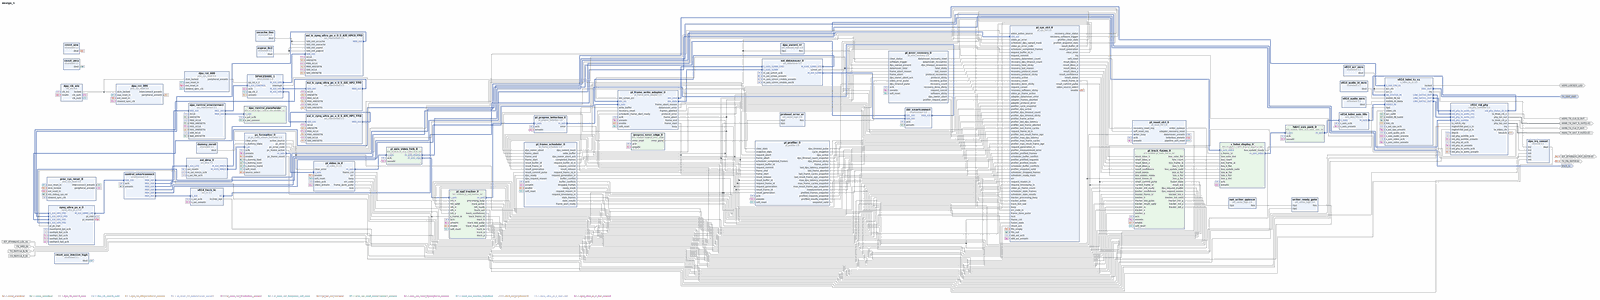
[diagram p0: block diagram of the top level, whole]
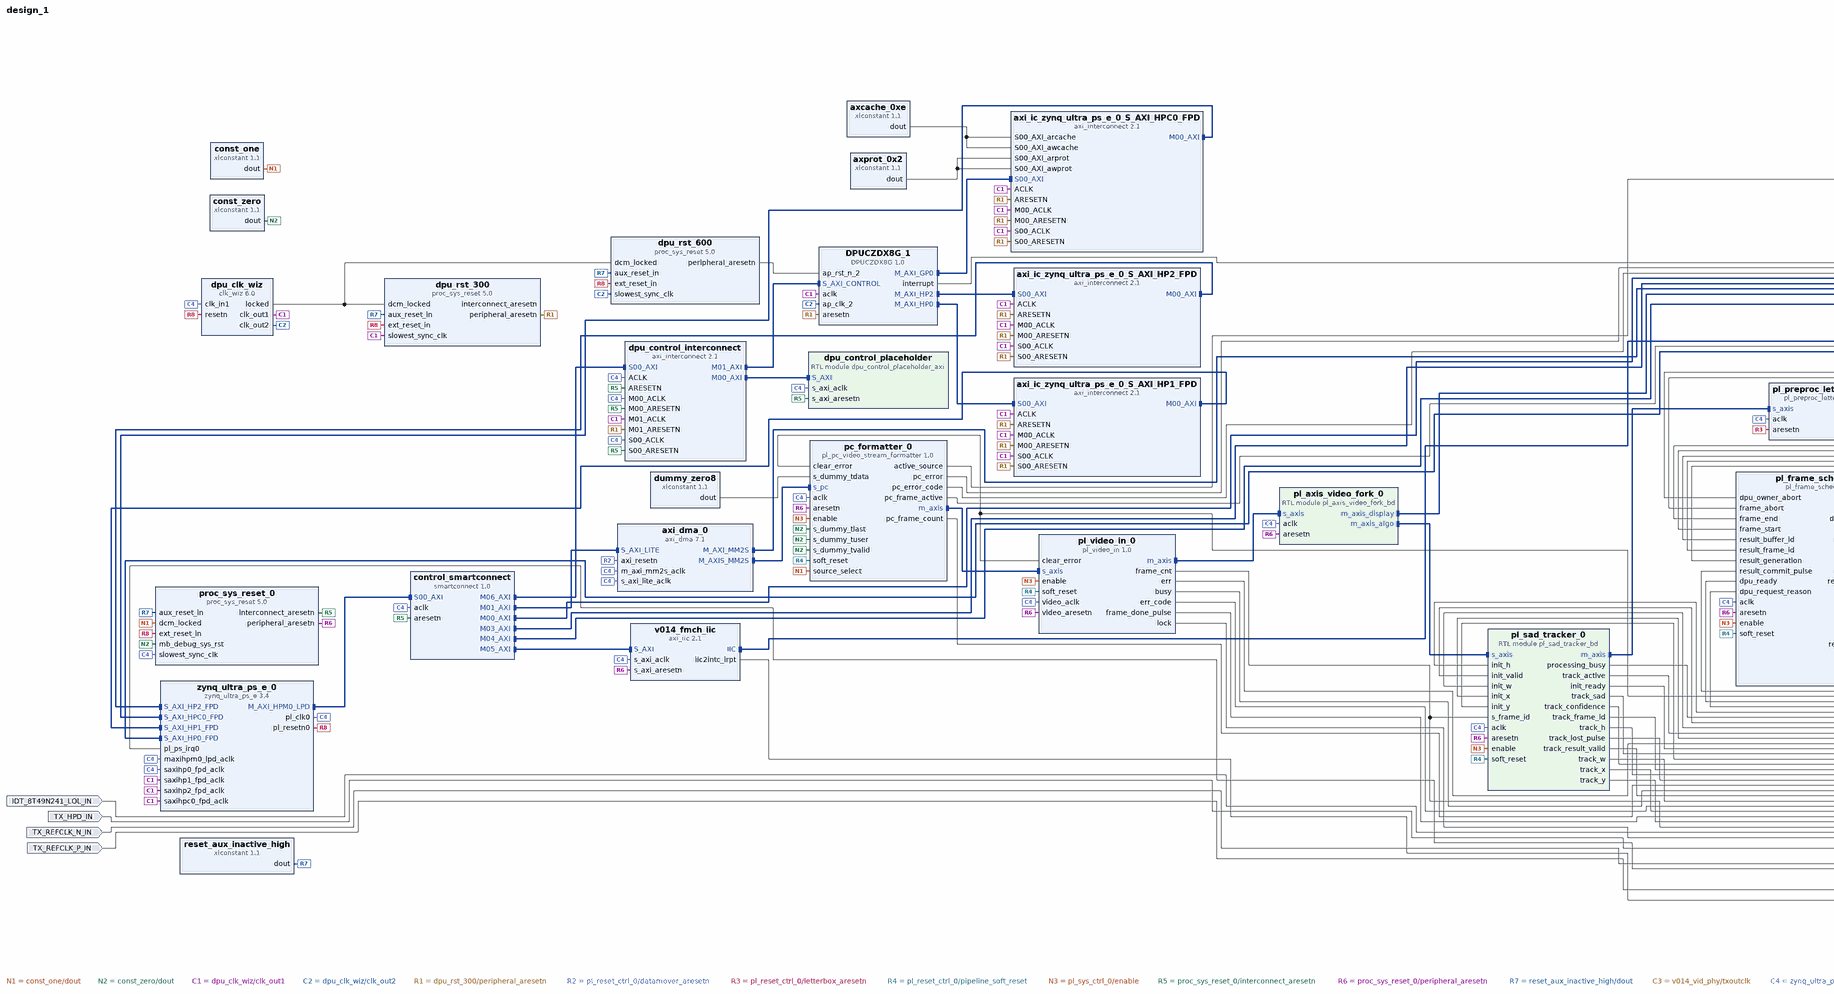
[diagram p1: block diagram of the top level, left part]
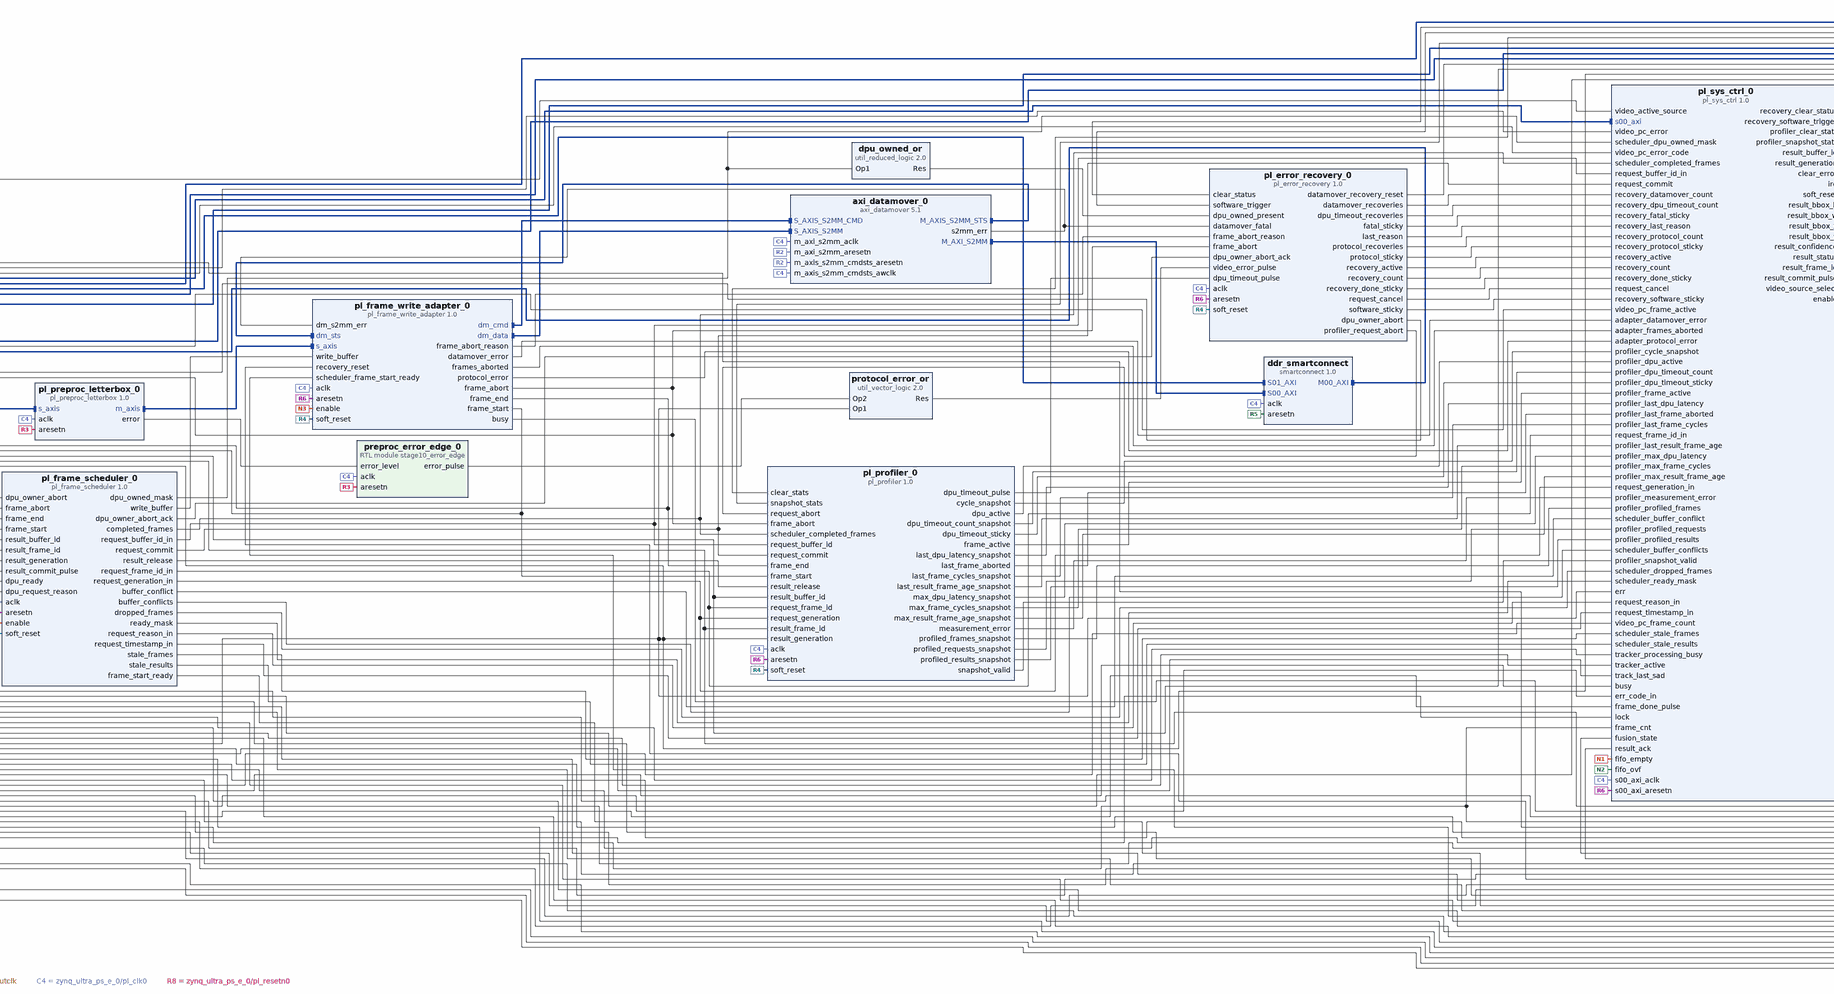
[diagram p2: block diagram of the top level, centre part]
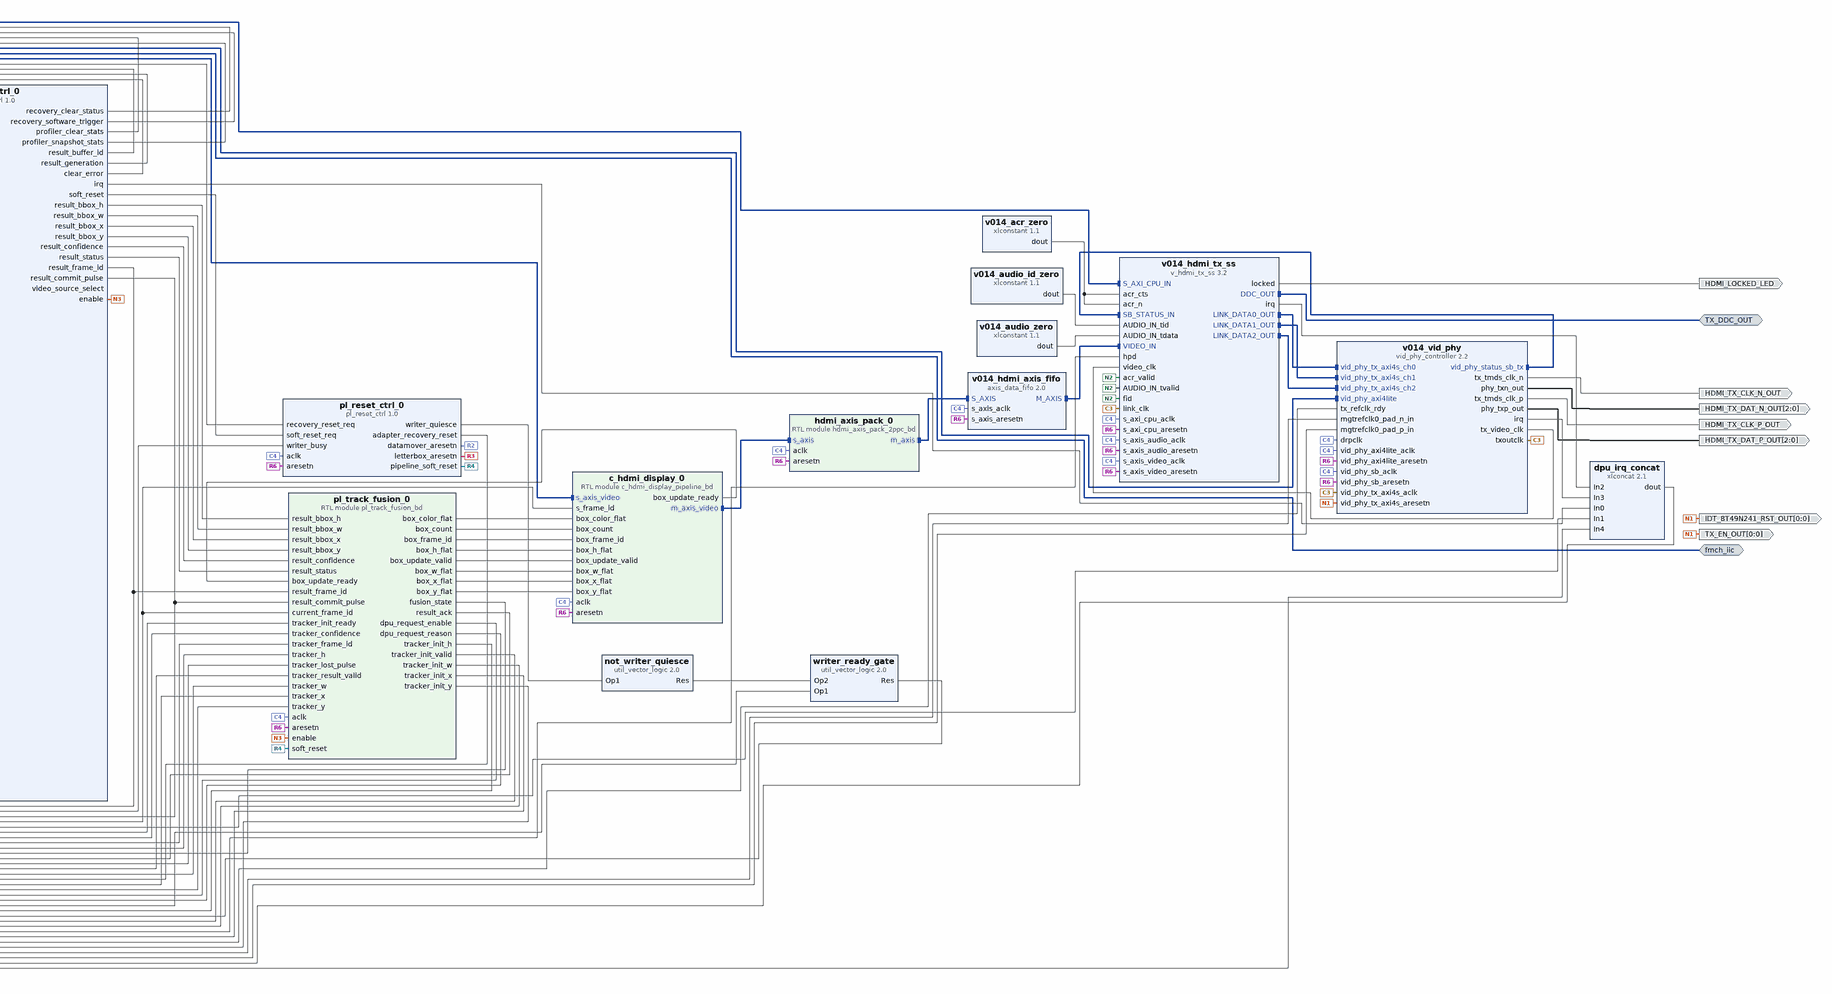
[diagram p3: block diagram of the top level, right part]
# Vivado block design design_1, xczu7ev-ffvc1156-2-e, Vivado 2022.2
create_bd_design design_1

create_bd_intf_port -mode Master -vlnv xilinx.com:interface:iic_rtl:1.0 TX_DDC_OUT
create_bd_intf_port -mode Master -vlnv xilinx.com:interface:iic_rtl:1.0 fmch_iic
create_bd_port -dir I TX_HPD_IN
create_bd_port -dir I -type clk TX_REFCLK_P_IN
create_bd_port -dir I -type clk TX_REFCLK_N_IN
create_bd_port -dir I IDT_8T49N241_LOL_IN
create_bd_port -dir O -from 0 -to 0 TX_EN_OUT
create_bd_port -dir O HDMI_LOCKED_LED
create_bd_port -dir O HDMI_TX_CLK_P_OUT
create_bd_port -dir O HDMI_TX_CLK_N_OUT
create_bd_port -dir O -from 2 -to 0 HDMI_TX_DAT_P_OUT
create_bd_port -dir O -from 2 -to 0 HDMI_TX_DAT_N_OUT
create_bd_port -dir O -from 0 -to 0 IDT_8T49N241_RST_OUT

create_bd_cell -type ip -vlnv xilinx.com:ip:axi_datamover:5.1 axi_datamover_0
set_property -dict [list \
  CONFIG.c_addr_width 40 \
  CONFIG.c_dummy 1 \
  CONFIG.c_enable_mm2s 0 \
  CONFIG.c_enable_s2mm 1 \
  CONFIG.c_include_s2mm Full \
  CONFIG.c_include_s2mm_dre false \
  CONFIG.c_include_s2mm_stsfifo true \
  CONFIG.c_m_axi_s2mm_addr_width 40 \
  CONFIG.c_m_axi_s2mm_data_width 64 \
  CONFIG.c_s2mm_btt_used 23 \
  CONFIG.c_s2mm_burst_size 16 \
  CONFIG.c_s2mm_support_indet_btt false \
  CONFIG.c_s_axis_s2mm_tdata_width 32 \
] [get_bd_cells axi_datamover_0]
create_bd_cell -type ip -vlnv xilinx.com:ip:axi_dma:7.1 axi_dma_0
set_property -dict [list \
  CONFIG.c_addr_width 32 \
  CONFIG.c_include_mm2s 1 \
  CONFIG.c_include_mm2s_dre 0 \
  CONFIG.c_include_mm2s_sf 1 \
  CONFIG.c_include_s2mm 0 \
  CONFIG.c_include_sg 0 \
  CONFIG.c_m_axi_mm2s_data_width 64 \
  CONFIG.c_m_axis_mm2s_tdata_width 8 \
  CONFIG.c_micro_dma 0 \
  CONFIG.c_mm2s_burst_size 16 \
  CONFIG.c_sg_length_width 23 \
] [get_bd_cells axi_dma_0]
create_bd_cell -type ip -vlnv xilinx.com:ip:xlconstant:1.1 const_one
set_property -dict {CONFIG.CONST_VAL 1 CONFIG.CONST_WIDTH 1} [get_bd_cells const_one]
create_bd_cell -type ip -vlnv xilinx.com:ip:xlconstant:1.1 const_zero
set_property -dict {CONFIG.CONST_VAL 0 CONFIG.CONST_WIDTH 1} [get_bd_cells const_zero]
create_bd_cell -type ip -vlnv xilinx.com:ip:smartconnect:1.0 control_smartconnect
set_property -dict {CONFIG.NUM_MI 7 CONFIG.NUM_SI 1} [get_bd_cells control_smartconnect]
create_bd_cell -type ip -vlnv xilinx.com:ip:util_vector_logic:2.0 writer_ready_gate
set_property -dict {CONFIG.C_OPERATION and CONFIG.C_SIZE 1} [get_bd_cells writer_ready_gate]
create_bd_cell -type ip -vlnv xilinx.com:ip:util_vector_logic:2.0 not_writer_quiesce
set_property -dict {CONFIG.C_OPERATION not CONFIG.C_SIZE 1} [get_bd_cells not_writer_quiesce]
create_bd_cell -type ip -vlnv xilinx.com:ip:smartconnect:1.0 ddr_smartconnect
set_property -dict {CONFIG.NUM_MI 1 CONFIG.NUM_SI 2} [get_bd_cells ddr_smartconnect]
create_bd_cell -type ip -vlnv xilinx.com:ip:util_reduced_logic:2.0 dpu_owned_or
set_property -dict {CONFIG.C_OPERATION or CONFIG.C_SIZE 3} [get_bd_cells dpu_owned_or]
create_bd_cell -type ip -vlnv xilinx.com:user:pl_pc_video_stream_formatter:1.0 pc_formatter_0
create_bd_cell -type ip -vlnv xilinx.com:user:pl_reset_ctrl:1.0 pl_reset_ctrl_0
create_bd_cell -type ip -vlnv xilinx.com:user:pl_error_recovery:1.0 pl_error_recovery_0
create_bd_cell -type ip -vlnv xilinx.com:user:pl_frame_write_adapter:1.0 pl_frame_write_adapter_0
set_property -dict {CONFIG.FRAME_BASE_ADDR 0x0020000000} [get_bd_cells pl_frame_write_adapter_0]
create_bd_cell -type ip -vlnv xilinx.com:user:pl_preproc_letterbox:1.0 pl_preproc_letterbox_0
create_bd_cell -type ip -vlnv xilinx.com:user:pl_profiler:1.0 pl_profiler_0
create_bd_cell -type ip -vlnv xilinx.com:user:pl_sys_ctrl:1.0 pl_sys_ctrl_0
create_bd_cell -type ip -vlnv xilinx.com:user:pl_video_in:1.0 pl_video_in_0
create_bd_cell -type module -reference stage10_error_edge preproc_error_edge_0
create_bd_cell -type ip -vlnv xilinx.com:ip:proc_sys_reset:5.0 proc_sys_reset_0
create_bd_cell -type ip -vlnv xilinx.com:ip:util_vector_logic:2.0 protocol_error_or
set_property -dict {CONFIG.C_OPERATION or CONFIG.C_SIZE 1} [get_bd_cells protocol_error_or]
create_bd_cell -type ip -vlnv xilinx.com:ip:zynq_ultra_ps_e:3.4 zynq_ultra_ps_e_0
set_property -dict [list \
  CONFIG.PSU__CRL_APB__PL0_REF_CTRL__FREQMHZ 100 \
  CONFIG.PSU__CRL_APB__PL0_REF_CTRL__SRCSEL IOPLL \
  CONFIG.PSU__DDR_HIGH_ADDRESS_GUI_ENABLE 0 \
  CONFIG.PSU__USE__IRQ 1 \
  CONFIG.PSU__USE__IRQ0 1 \
  CONFIG.PSU__USE__S_AXI_GP0 1 \
  CONFIG.PSU__USE__S_AXI_GP2 1 \
  CONFIG.PSU__USE__S_AXI_GP3 1 \
  CONFIG.PSU__USE__S_AXI_GP4 1 \
] [get_bd_cells zynq_ultra_ps_e_0]
# 31 more settings of zynq_ultra_ps_e_0 are not shown: defaults, MIO pin electricals, DDR timing, and values the tool derives
create_bd_cell -type ip -vlnv xilinx.com:ip:xlconstant:1.1 dummy_zero8
set_property -dict {CONFIG.CONST_VAL 0 CONFIG.CONST_WIDTH 8} [get_bd_cells dummy_zero8]
create_bd_cell -type module -reference pl_axis_video_fork_bd pl_axis_video_fork_0
create_bd_cell -type module -reference pl_sad_tracker_bd pl_sad_tracker_0
create_bd_cell -type module -reference pl_track_fusion_bd pl_track_fusion_0
create_bd_cell -type module -reference c_hdmi_display_pipeline_bd c_hdmi_display_0
create_bd_cell -type module -reference hdmi_axis_pack_2ppc_bd hdmi_axis_pack_0
create_bd_cell -type ip -vlnv xilinx.com:ip:clk_wiz:6.0 dpu_clk_wiz
set_property -dict [list \
  CONFIG.CLKOUT1_REQUESTED_OUT_FREQ 300.000 \
  CONFIG.CLKOUT2_REQUESTED_OUT_FREQ 600.000 \
  CONFIG.CLKOUT2_USED true \
  CONFIG.PRIM_IN_FREQ 99.999001 \
  CONFIG.PRIM_SOURCE No_buffer \
  CONFIG.RESET_TYPE ACTIVE_LOW \
  CONFIG.USE_LOCKED true \
  CONFIG.USE_RESET true \
] [get_bd_cells dpu_clk_wiz]
create_bd_cell -type ip -vlnv xilinx.com:ip:proc_sys_reset:5.0 dpu_rst_300
create_bd_cell -type ip -vlnv xilinx.com:ip:proc_sys_reset:5.0 dpu_rst_600
create_bd_cell -type ip -vlnv xilinx.com:ip:xlconcat:2.1 dpu_irq_concat
set_property -dict {CONFIG.NUM_PORTS 5} [get_bd_cells dpu_irq_concat]
create_bd_cell -type ip -vlnv xilinx.com:ip:axis_data_fifo:2.0 v014_hdmi_axis_fifo
set_property -dict [list \
  CONFIG.FIFO_DEPTH 1024 \
  CONFIG.HAS_TLAST 1 \
  CONFIG.IS_ACLK_ASYNC 0 \
  CONFIG.TDATA_NUM_BYTES 6 \
  CONFIG.TUSER_WIDTH 1 \
] [get_bd_cells v014_hdmi_axis_fifo]
create_bd_cell -type ip -vlnv xilinx.com:ip:v_hdmi_tx_ss:3.2 v014_hdmi_tx_ss
set_property -dict [list \
  CONFIG.C_ADDR_WIDTH 10 \
  CONFIG.C_EXDES_AXILITE_FREQ 100 \
  CONFIG.C_EXDES_TOPOLOGY 1 \
  CONFIG.C_EXDES_TX_PLL_SELECTION 6 \
  CONFIG.C_HDMI_FAST_SWITCH true \
  CONFIG.C_HDMI_VERSION 3 \
  CONFIG.C_HPD_INVERT false \
  CONFIG.C_INCLUDE_HDCP_1_4 false \
  CONFIG.C_INCLUDE_HDCP_2_2 false \
  CONFIG.C_INCLUDE_LOW_RESO_VID false \
  CONFIG.C_INCLUDE_YUV420_SUP false \
  CONFIG.C_INPUT_PIXELS_PER_CLOCK 2 \
  CONFIG.C_MAX_BITS_PER_COMPONENT 8 \
  CONFIG.C_VALIDATION_ENABLE false \
  CONFIG.C_VIDEO_MASK_ENABLE 1 \
  CONFIG.C_VID_INTERFACE 0 \
] [get_bd_cells v014_hdmi_tx_ss]
create_bd_cell -type ip -vlnv xilinx.com:ip:vid_phy_controller:2.2 v014_vid_phy
set_property -dict [list \
  CONFIG.CHANNEL_SITE X0Y16 \
  CONFIG.C_INPUT_PIXELS_PER_CLOCK 2 \
  CONFIG.C_INT_HDMI_VER_CMPTBLE 3 \
  CONFIG.C_RX_PLL_SELECTION 0 \
  CONFIG.C_RX_REFCLK_SEL 1 \
  CONFIG.C_Rx_Protocol None \
  CONFIG.C_TX_PLL_SELECTION 6 \
  CONFIG.C_TX_REFCLK_SEL 0 \
  CONFIG.C_Tx_Protocol HDMI \
  CONFIG.C_Txrefclk_Rdy_Invert true \
] [get_bd_cells v014_vid_phy]
create_bd_cell -type ip -vlnv xilinx.com:ip:axi_iic:2.1 v014_fmch_iic
set_property -dict {CONFIG.IIC_BOARD_INTERFACE Custom CONFIG.USE_BOARD_FLOW true} [get_bd_cells v014_fmch_iic]
create_bd_cell -type ip -vlnv xilinx.com:ip:xlconstant:1.1 v014_audio_zero
set_property -dict {CONFIG.CONST_VAL 0 CONFIG.CONST_WIDTH 32} [get_bd_cells v014_audio_zero]
create_bd_cell -type ip -vlnv xilinx.com:ip:xlconstant:1.1 v014_audio_id_zero
set_property -dict {CONFIG.CONST_VAL 0 CONFIG.CONST_WIDTH 8} [get_bd_cells v014_audio_id_zero]
create_bd_cell -type ip -vlnv xilinx.com:ip:xlconstant:1.1 v014_acr_zero
set_property -dict {CONFIG.CONST_VAL 0 CONFIG.CONST_WIDTH 20} [get_bd_cells v014_acr_zero]
create_bd_cell -type module -reference dpu_control_placeholder_axi dpu_control_placeholder
create_bd_cell -type ip -vlnv xilinx.com:ip:xlconstant:1.1 reset_aux_inactive_high
set_property -dict {CONFIG.CONST_VAL 1 CONFIG.CONST_WIDTH 1} [get_bd_cells reset_aux_inactive_high]
create_bd_cell -type ip -vlnv xilinx.com:user:pl_frame_scheduler:1.0 pl_frame_scheduler_0
create_bd_cell -type ip -vlnv xilinx.com:ip:axi_interconnect:2.1 dpu_control_interconnect
set_property -dict {CONFIG.M01_HAS_REGSLICE 1 CONFIG.NUM_MI 2 CONFIG.NUM_SI 1} [get_bd_cells dpu_control_interconnect]
create_bd_cell -type ip -vlnv xilinx.com:RTLKernel:DPUCZDX8G:1.0 DPUCZDX8G_1
create_bd_cell -type ip -vlnv xilinx.com:ip:axi_interconnect:2.1 axi_ic_zynq_ultra_ps_e_0_S_AXI_HPC0_FPD
set_property -dict [list \
  CONFIG.M00_HAS_REGSLICE 0 \
  CONFIG.NUM_MI 1 \
  CONFIG.NUM_SI 1 \
  CONFIG.S00_HAS_REGSLICE 0 \
] [get_bd_cells axi_ic_zynq_ultra_ps_e_0_S_AXI_HPC0_FPD]
create_bd_cell -type ip -vlnv xilinx.com:ip:axi_interconnect:2.1 axi_ic_zynq_ultra_ps_e_0_S_AXI_HP1_FPD
set_property -dict [list \
  CONFIG.M00_HAS_REGSLICE 0 \
  CONFIG.NUM_MI 1 \
  CONFIG.NUM_SI 1 \
  CONFIG.S00_HAS_REGSLICE 0 \
] [get_bd_cells axi_ic_zynq_ultra_ps_e_0_S_AXI_HP1_FPD]
create_bd_cell -type ip -vlnv xilinx.com:ip:axi_interconnect:2.1 axi_ic_zynq_ultra_ps_e_0_S_AXI_HP2_FPD
set_property -dict [list \
  CONFIG.M00_HAS_REGSLICE 0 \
  CONFIG.NUM_MI 1 \
  CONFIG.NUM_SI 1 \
  CONFIG.S00_HAS_REGSLICE 0 \
] [get_bd_cells axi_ic_zynq_ultra_ps_e_0_S_AXI_HP2_FPD]
create_bd_cell -type ip -vlnv xilinx.com:ip:xlconstant:1.1 axcache_0xe
set_property -dict {CONFIG.CONST_VAL 14 CONFIG.CONST_WIDTH 4} [get_bd_cells axcache_0xe]
create_bd_cell -type ip -vlnv xilinx.com:ip:xlconstant:1.1 axprot_0x2
set_property -dict {CONFIG.CONST_VAL 2 CONFIG.CONST_WIDTH 3} [get_bd_cells axprot_0x2]

# ---- connections ----

connect_bd_intf_net [get_bd_intf_pins DPUCZDX8G_1/M_AXI_GP0] [get_bd_intf_pins axi_ic_zynq_ultra_ps_e_0_S_AXI_HPC0_FPD/S00_AXI]
connect_bd_intf_net [get_bd_intf_pins DPUCZDX8G_1/M_AXI_HP0] [get_bd_intf_pins axi_ic_zynq_ultra_ps_e_0_S_AXI_HP1_FPD/S00_AXI]
connect_bd_intf_net [get_bd_intf_pins DPUCZDX8G_1/M_AXI_HP2] [get_bd_intf_pins axi_ic_zynq_ultra_ps_e_0_S_AXI_HP2_FPD/S00_AXI]
connect_bd_intf_net [get_bd_intf_pins axi_datamover_0/M_AXIS_S2MM_STS] [get_bd_intf_pins pl_frame_write_adapter_0/dm_sts]
connect_bd_intf_net [get_bd_intf_pins axi_datamover_0/M_AXI_S2MM] [get_bd_intf_pins ddr_smartconnect/S00_AXI]
connect_bd_intf_net [get_bd_intf_pins axi_dma_0/M_AXIS_MM2S] [get_bd_intf_pins pc_formatter_0/s_pc]
connect_bd_intf_net [get_bd_intf_pins axi_dma_0/M_AXI_MM2S] [get_bd_intf_pins ddr_smartconnect/S01_AXI]
connect_bd_intf_net [get_bd_intf_pins axi_ic_zynq_ultra_ps_e_0_S_AXI_HP1_FPD/M00_AXI] [get_bd_intf_pins zynq_ultra_ps_e_0/S_AXI_HP1_FPD]
connect_bd_intf_net [get_bd_intf_pins axi_ic_zynq_ultra_ps_e_0_S_AXI_HP2_FPD/M00_AXI] [get_bd_intf_pins zynq_ultra_ps_e_0/S_AXI_HP2_FPD]
connect_bd_intf_net [get_bd_intf_pins axi_ic_zynq_ultra_ps_e_0_S_AXI_HPC0_FPD/M00_AXI] [get_bd_intf_pins zynq_ultra_ps_e_0/S_AXI_HPC0_FPD]
connect_bd_intf_net [get_bd_intf_pins c_hdmi_display_0/m_axis_video] [get_bd_intf_pins hdmi_axis_pack_0/s_axis]
connect_bd_intf_net [get_bd_intf_pins control_smartconnect/M00_AXI] [get_bd_intf_pins pl_sys_ctrl_0/s00_axi]
connect_bd_intf_net [get_bd_intf_pins control_smartconnect/M01_AXI] [get_bd_intf_pins axi_dma_0/S_AXI_LITE]
connect_bd_intf_net [get_bd_intf_pins control_smartconnect/M03_AXI] [get_bd_intf_pins v014_hdmi_tx_ss/S_AXI_CPU_IN]
connect_bd_intf_net [get_bd_intf_pins control_smartconnect/M04_AXI] [get_bd_intf_pins v014_vid_phy/vid_phy_axi4lite]
connect_bd_intf_net [get_bd_intf_pins control_smartconnect/M05_AXI] [get_bd_intf_pins v014_fmch_iic/S_AXI]
connect_bd_intf_net [get_bd_intf_pins control_smartconnect/M06_AXI] [get_bd_intf_pins dpu_control_interconnect/S00_AXI]
connect_bd_intf_net [get_bd_intf_pins ddr_smartconnect/M00_AXI] [get_bd_intf_pins zynq_ultra_ps_e_0/S_AXI_HP0_FPD]
connect_bd_intf_net [get_bd_intf_pins dpu_control_interconnect/M00_AXI] [get_bd_intf_pins dpu_control_placeholder/S_AXI]
connect_bd_intf_net [get_bd_intf_pins dpu_control_interconnect/M01_AXI] [get_bd_intf_pins DPUCZDX8G_1/S_AXI_CONTROL]
connect_bd_intf_net [get_bd_intf_pins v014_hdmi_axis_fifo/S_AXIS] [get_bd_intf_pins hdmi_axis_pack_0/m_axis]
connect_bd_intf_net [get_bd_intf_pins pc_formatter_0/m_axis] [get_bd_intf_pins pl_video_in_0/s_axis]
connect_bd_intf_net [get_bd_intf_pins pl_axis_video_fork_0/m_axis_algo] [get_bd_intf_pins pl_sad_tracker_0/s_axis]
connect_bd_intf_net [get_bd_intf_pins pl_axis_video_fork_0/m_axis_display] [get_bd_intf_pins c_hdmi_display_0/s_axis_video]
connect_bd_intf_net [get_bd_intf_pins axi_datamover_0/S_AXIS_S2MM_CMD] [get_bd_intf_pins pl_frame_write_adapter_0/dm_cmd]
connect_bd_intf_net [get_bd_intf_pins axi_datamover_0/S_AXIS_S2MM] [get_bd_intf_pins pl_frame_write_adapter_0/dm_data]
connect_bd_intf_net [get_bd_intf_pins pl_frame_write_adapter_0/s_axis] [get_bd_intf_pins pl_preproc_letterbox_0/m_axis]
connect_bd_intf_net [get_bd_intf_pins pl_sad_tracker_0/m_axis] [get_bd_intf_pins pl_preproc_letterbox_0/s_axis]
connect_bd_intf_net [get_bd_intf_pins pl_video_in_0/m_axis] [get_bd_intf_pins pl_axis_video_fork_0/s_axis]
connect_bd_intf_net [get_bd_intf_ports fmch_iic] [get_bd_intf_pins v014_fmch_iic/IIC]
connect_bd_intf_net [get_bd_intf_pins v014_hdmi_axis_fifo/M_AXIS] [get_bd_intf_pins v014_hdmi_tx_ss/VIDEO_IN]
connect_bd_intf_net [get_bd_intf_ports TX_DDC_OUT] [get_bd_intf_pins v014_hdmi_tx_ss/DDC_OUT]
connect_bd_intf_net [get_bd_intf_pins v014_hdmi_tx_ss/LINK_DATA0_OUT] [get_bd_intf_pins v014_vid_phy/vid_phy_tx_axi4s_ch0]
connect_bd_intf_net [get_bd_intf_pins v014_hdmi_tx_ss/LINK_DATA1_OUT] [get_bd_intf_pins v014_vid_phy/vid_phy_tx_axi4s_ch1]
connect_bd_intf_net [get_bd_intf_pins v014_hdmi_tx_ss/LINK_DATA2_OUT] [get_bd_intf_pins v014_vid_phy/vid_phy_tx_axi4s_ch2]
connect_bd_intf_net [get_bd_intf_pins v014_vid_phy/vid_phy_status_sb_tx] [get_bd_intf_pins v014_hdmi_tx_ss/SB_STATUS_IN]
connect_bd_intf_net [get_bd_intf_pins control_smartconnect/S00_AXI] [get_bd_intf_pins zynq_ultra_ps_e_0/M_AXI_HPM0_LPD]
connect_bd_net [get_bd_pins DPUCZDX8G_1/interrupt] [get_bd_pins dpu_irq_concat/In1]
connect_bd_net [get_bd_ports IDT_8T49N241_LOL_IN] [get_bd_pins v014_vid_phy/tx_refclk_rdy]
connect_bd_net [get_bd_ports TX_HPD_IN] [get_bd_pins v014_hdmi_tx_ss/hpd]
connect_bd_net [get_bd_ports TX_REFCLK_N_IN] [get_bd_pins v014_vid_phy/mgtrefclk0_pad_n_in]
connect_bd_net [get_bd_ports TX_REFCLK_P_IN] [get_bd_pins v014_vid_phy/mgtrefclk0_pad_p_in]
connect_bd_net [get_bd_pins axcache_0xe/dout] \
  [get_bd_pins axi_ic_zynq_ultra_ps_e_0_S_AXI_HPC0_FPD/S00_AXI_arcache] \
  [get_bd_pins axi_ic_zynq_ultra_ps_e_0_S_AXI_HPC0_FPD/S00_AXI_awcache]
connect_bd_net [get_bd_pins axi_datamover_0/s2mm_err] \
  [get_bd_pins pl_error_recovery_0/datamover_fatal] [get_bd_pins pl_frame_write_adapter_0/dm_s2mm_err]
connect_bd_net [get_bd_pins axprot_0x2/dout] \
  [get_bd_pins axi_ic_zynq_ultra_ps_e_0_S_AXI_HPC0_FPD/S00_AXI_arprot] \
  [get_bd_pins axi_ic_zynq_ultra_ps_e_0_S_AXI_HPC0_FPD/S00_AXI_awprot]
connect_bd_net [get_bd_pins c_hdmi_display_0/box_update_ready] [get_bd_pins pl_track_fusion_0/box_update_ready]
connect_bd_net [get_bd_pins const_one/dout] \
  [get_bd_pins pl_sys_ctrl_0/fifo_empty] [get_bd_pins proc_sys_reset_0/dcm_locked] [get_bd_pins pc_formatter_0/source_select] \
  [get_bd_ports TX_EN_OUT] [get_bd_pins v014_vid_phy/vid_phy_tx_axi4s_aresetn] [get_bd_ports IDT_8T49N241_RST_OUT]
connect_bd_net [get_bd_pins const_zero/dout] \
  [get_bd_pins pl_sys_ctrl_0/fifo_ovf] [get_bd_pins proc_sys_reset_0/mb_debug_sys_rst] \
  [get_bd_pins pc_formatter_0/s_dummy_tvalid] [get_bd_pins pc_formatter_0/s_dummy_tuser] \
  [get_bd_pins pc_formatter_0/s_dummy_tlast] [get_bd_pins v014_hdmi_tx_ss/AUDIO_IN_tvalid] \
  [get_bd_pins v014_hdmi_tx_ss/acr_valid] [get_bd_pins v014_hdmi_tx_ss/fid]
connect_bd_net [get_bd_pins dpu_clk_wiz/clk_out1] \
  [get_bd_pins dpu_rst_300/slowest_sync_clk] [get_bd_pins zynq_ultra_ps_e_0/saxihpc0_fpd_aclk] \
  [get_bd_pins zynq_ultra_ps_e_0/saxihp1_fpd_aclk] [get_bd_pins zynq_ultra_ps_e_0/saxihp2_fpd_aclk] \
  [get_bd_pins DPUCZDX8G_1/aclk] [get_bd_pins axi_ic_zynq_ultra_ps_e_0_S_AXI_HPC0_FPD/M00_ACLK] \
  [get_bd_pins axi_ic_zynq_ultra_ps_e_0_S_AXI_HPC0_FPD/S00_ACLK] [get_bd_pins axi_ic_zynq_ultra_ps_e_0_S_AXI_HPC0_FPD/ACLK] \
  [get_bd_pins axi_ic_zynq_ultra_ps_e_0_S_AXI_HP1_FPD/M00_ACLK] [get_bd_pins axi_ic_zynq_ultra_ps_e_0_S_AXI_HP1_FPD/S00_ACLK] \
  [get_bd_pins axi_ic_zynq_ultra_ps_e_0_S_AXI_HP1_FPD/ACLK] [get_bd_pins axi_ic_zynq_ultra_ps_e_0_S_AXI_HP2_FPD/M00_ACLK] \
  [get_bd_pins axi_ic_zynq_ultra_ps_e_0_S_AXI_HP2_FPD/S00_ACLK] [get_bd_pins axi_ic_zynq_ultra_ps_e_0_S_AXI_HP2_FPD/ACLK] \
  [get_bd_pins dpu_control_interconnect/M01_ACLK]
connect_bd_net [get_bd_pins dpu_clk_wiz/clk_out2] [get_bd_pins dpu_rst_600/slowest_sync_clk] [get_bd_pins DPUCZDX8G_1/ap_clk_2]
connect_bd_net [get_bd_pins dpu_clk_wiz/locked] [get_bd_pins dpu_rst_300/dcm_locked] [get_bd_pins dpu_rst_600/dcm_locked]
connect_bd_net [get_bd_pins dpu_irq_concat/dout] [get_bd_pins zynq_ultra_ps_e_0/pl_ps_irq0]
connect_bd_net [get_bd_pins dpu_owned_or/Res] [get_bd_pins pl_error_recovery_0/dpu_owned_present]
# net dpu_rst_300_interconnect_aresetn has one end: dpu_rst_300/interconnect_aresetn
connect_bd_net [get_bd_pins dpu_rst_300/peripheral_aresetn] \
  [get_bd_pins DPUCZDX8G_1/aresetn] [get_bd_pins axi_ic_zynq_ultra_ps_e_0_S_AXI_HPC0_FPD/M00_ARESETN] \
  [get_bd_pins axi_ic_zynq_ultra_ps_e_0_S_AXI_HPC0_FPD/S00_ARESETN] \
  [get_bd_pins axi_ic_zynq_ultra_ps_e_0_S_AXI_HPC0_FPD/ARESETN] \
  [get_bd_pins axi_ic_zynq_ultra_ps_e_0_S_AXI_HP1_FPD/M00_ARESETN] \
  [get_bd_pins axi_ic_zynq_ultra_ps_e_0_S_AXI_HP1_FPD/S00_ARESETN] \
  [get_bd_pins axi_ic_zynq_ultra_ps_e_0_S_AXI_HP1_FPD/ARESETN] \
  [get_bd_pins axi_ic_zynq_ultra_ps_e_0_S_AXI_HP2_FPD/M00_ARESETN] \
  [get_bd_pins axi_ic_zynq_ultra_ps_e_0_S_AXI_HP2_FPD/S00_ARESETN] \
  [get_bd_pins axi_ic_zynq_ultra_ps_e_0_S_AXI_HP2_FPD/ARESETN] [get_bd_pins dpu_control_interconnect/M01_ARESETN]
connect_bd_net [get_bd_pins dpu_rst_600/peripheral_aresetn] [get_bd_pins DPUCZDX8G_1/ap_rst_n_2]
connect_bd_net [get_bd_pins dummy_zero8/dout] [get_bd_pins pc_formatter_0/s_dummy_tdata]
connect_bd_net [get_bd_pins not_writer_quiesce/Res] [get_bd_pins writer_ready_gate/Op2]
connect_bd_net [get_bd_pins pc_formatter_0/active_source] [get_bd_pins pl_sys_ctrl_0/video_active_source]
connect_bd_net [get_bd_pins pc_formatter_0/pc_error] [get_bd_pins pl_sys_ctrl_0/video_pc_error]
connect_bd_net [get_bd_pins pc_formatter_0/pc_error_code] [get_bd_pins pl_sys_ctrl_0/video_pc_error_code]
connect_bd_net [get_bd_pins pc_formatter_0/pc_frame_active] [get_bd_pins pl_sys_ctrl_0/video_pc_frame_active]
connect_bd_net [get_bd_pins pc_formatter_0/pc_frame_count] [get_bd_pins pl_sys_ctrl_0/video_pc_frame_count]
connect_bd_net [get_bd_pins pl_error_recovery_0/datamover_recoveries] [get_bd_pins pl_sys_ctrl_0/recovery_datamover_count]
connect_bd_net [get_bd_pins pl_error_recovery_0/datamover_recovery_reset] [get_bd_pins pl_reset_ctrl_0/recovery_reset_req]
connect_bd_net [get_bd_pins pl_error_recovery_0/dpu_owner_abort] [get_bd_pins pl_frame_scheduler_0/dpu_owner_abort]
connect_bd_net [get_bd_pins pl_error_recovery_0/dpu_timeout_recoveries] [get_bd_pins pl_sys_ctrl_0/recovery_dpu_timeout_count]
connect_bd_net [get_bd_pins pl_error_recovery_0/fatal_sticky] [get_bd_pins pl_sys_ctrl_0/recovery_fatal_sticky]
connect_bd_net [get_bd_pins pl_error_recovery_0/last_reason] [get_bd_pins pl_sys_ctrl_0/recovery_last_reason]
connect_bd_net [get_bd_pins pl_error_recovery_0/profiler_request_abort] [get_bd_pins pl_profiler_0/request_abort]
connect_bd_net [get_bd_pins pl_error_recovery_0/protocol_recoveries] [get_bd_pins pl_sys_ctrl_0/recovery_protocol_count]
connect_bd_net [get_bd_pins pl_error_recovery_0/protocol_sticky] [get_bd_pins pl_sys_ctrl_0/recovery_protocol_sticky]
connect_bd_net [get_bd_pins pl_error_recovery_0/recovery_active] [get_bd_pins pl_sys_ctrl_0/recovery_active]
connect_bd_net [get_bd_pins pl_error_recovery_0/recovery_count] [get_bd_pins pl_sys_ctrl_0/recovery_count]
connect_bd_net [get_bd_pins pl_error_recovery_0/recovery_done_sticky] [get_bd_pins pl_sys_ctrl_0/recovery_done_sticky]
connect_bd_net [get_bd_pins pl_error_recovery_0/request_cancel] [get_bd_pins pl_sys_ctrl_0/request_cancel]
connect_bd_net [get_bd_pins pl_error_recovery_0/software_sticky] [get_bd_pins pl_sys_ctrl_0/recovery_software_sticky]
connect_bd_net [get_bd_pins pl_frame_scheduler_0/buffer_conflict] [get_bd_pins pl_sys_ctrl_0/scheduler_buffer_conflict]
connect_bd_net [get_bd_pins pl_frame_scheduler_0/buffer_conflicts] [get_bd_pins pl_sys_ctrl_0/scheduler_buffer_conflicts]
connect_bd_net [get_bd_pins pl_frame_scheduler_0/completed_frames] \
  [get_bd_pins pl_profiler_0/scheduler_completed_frames] [get_bd_pins pl_sys_ctrl_0/scheduler_completed_frames]
connect_bd_net [get_bd_pins pl_frame_scheduler_0/dpu_owned_mask] [get_bd_pins dpu_owned_or/Op1] [get_bd_pins pl_sys_ctrl_0/scheduler_dpu_owned_mask]
connect_bd_net [get_bd_pins pl_frame_scheduler_0/dpu_owner_abort_ack] [get_bd_pins pl_error_recovery_0/dpu_owner_abort_ack]
connect_bd_net [get_bd_pins pl_frame_scheduler_0/dropped_frames] [get_bd_pins pl_sys_ctrl_0/scheduler_dropped_frames]
connect_bd_net [get_bd_pins pl_frame_scheduler_0/frame_start_ready] [get_bd_pins writer_ready_gate/Op1]
connect_bd_net [get_bd_pins pl_frame_scheduler_0/ready_mask] [get_bd_pins pl_sys_ctrl_0/scheduler_ready_mask]
connect_bd_net [get_bd_pins pl_frame_scheduler_0/request_buffer_id_in] \
  [get_bd_pins pl_profiler_0/request_buffer_id] [get_bd_pins pl_sys_ctrl_0/request_buffer_id_in]
connect_bd_net [get_bd_pins pl_frame_scheduler_0/request_commit] [get_bd_pins pl_profiler_0/request_commit] [get_bd_pins pl_sys_ctrl_0/request_commit]
connect_bd_net [get_bd_pins pl_frame_scheduler_0/request_frame_id_in] \
  [get_bd_pins pl_profiler_0/request_frame_id] [get_bd_pins pl_sys_ctrl_0/request_frame_id_in]
connect_bd_net [get_bd_pins pl_frame_scheduler_0/request_generation_in] \
  [get_bd_pins pl_profiler_0/request_generation] [get_bd_pins pl_sys_ctrl_0/request_generation_in]
connect_bd_net [get_bd_pins pl_frame_scheduler_0/request_reason_in] [get_bd_pins pl_sys_ctrl_0/request_reason_in]
connect_bd_net [get_bd_pins pl_frame_scheduler_0/request_timestamp_in] [get_bd_pins pl_sys_ctrl_0/request_timestamp_in]
connect_bd_net [get_bd_pins pl_frame_scheduler_0/result_release] [get_bd_pins pl_profiler_0/result_release]
connect_bd_net [get_bd_pins pl_frame_scheduler_0/stale_frames] [get_bd_pins pl_sys_ctrl_0/scheduler_stale_frames]
connect_bd_net [get_bd_pins pl_frame_scheduler_0/stale_results] [get_bd_pins pl_sys_ctrl_0/scheduler_stale_results]
connect_bd_net [get_bd_pins pl_frame_scheduler_0/write_buffer] [get_bd_pins pl_frame_write_adapter_0/write_buffer]
connect_bd_net [get_bd_pins pl_frame_write_adapter_0/busy] [get_bd_pins pl_reset_ctrl_0/writer_busy]
connect_bd_net [get_bd_pins pl_frame_write_adapter_0/datamover_error] [get_bd_pins pl_sys_ctrl_0/adapter_datamover_error]
connect_bd_net [get_bd_pins pl_frame_write_adapter_0/frame_abort] \
  [get_bd_pins pl_error_recovery_0/frame_abort] [get_bd_pins pl_profiler_0/frame_abort] \
  [get_bd_pins pl_frame_scheduler_0/frame_abort]
connect_bd_net [get_bd_pins pl_frame_write_adapter_0/frame_abort_reason] [get_bd_pins pl_error_recovery_0/frame_abort_reason]
connect_bd_net [get_bd_pins pl_frame_write_adapter_0/frame_end] [get_bd_pins pl_profiler_0/frame_end] [get_bd_pins pl_frame_scheduler_0/frame_end]
connect_bd_net [get_bd_pins pl_frame_write_adapter_0/frame_start] \
  [get_bd_pins pl_profiler_0/frame_start] [get_bd_pins pl_frame_scheduler_0/frame_start]
connect_bd_net [get_bd_pins pl_frame_write_adapter_0/frames_aborted] [get_bd_pins pl_sys_ctrl_0/adapter_frames_aborted]
connect_bd_net [get_bd_pins pl_frame_write_adapter_0/protocol_error] [get_bd_pins pl_sys_ctrl_0/adapter_protocol_error]
connect_bd_net [get_bd_pins pl_preproc_letterbox_0/error] [get_bd_pins preproc_error_edge_0/error_level]
connect_bd_net [get_bd_pins pl_profiler_0/cycle_snapshot] [get_bd_pins pl_sys_ctrl_0/profiler_cycle_snapshot]
connect_bd_net [get_bd_pins pl_profiler_0/dpu_active] [get_bd_pins pl_sys_ctrl_0/profiler_dpu_active]
connect_bd_net [get_bd_pins pl_profiler_0/dpu_timeout_count_snapshot] [get_bd_pins pl_sys_ctrl_0/profiler_dpu_timeout_count]
connect_bd_net [get_bd_pins pl_profiler_0/dpu_timeout_pulse] [get_bd_pins pl_error_recovery_0/dpu_timeout_pulse]
connect_bd_net [get_bd_pins pl_profiler_0/dpu_timeout_sticky] [get_bd_pins pl_sys_ctrl_0/profiler_dpu_timeout_sticky]
connect_bd_net [get_bd_pins pl_profiler_0/frame_active] [get_bd_pins pl_sys_ctrl_0/profiler_frame_active]
connect_bd_net [get_bd_pins pl_profiler_0/last_dpu_latency_snapshot] [get_bd_pins pl_sys_ctrl_0/profiler_last_dpu_latency]
connect_bd_net [get_bd_pins pl_profiler_0/last_frame_aborted] [get_bd_pins pl_sys_ctrl_0/profiler_last_frame_aborted]
connect_bd_net [get_bd_pins pl_profiler_0/last_frame_cycles_snapshot] [get_bd_pins pl_sys_ctrl_0/profiler_last_frame_cycles]
connect_bd_net [get_bd_pins pl_profiler_0/last_result_frame_age_snapshot] [get_bd_pins pl_sys_ctrl_0/profiler_last_result_frame_age]
connect_bd_net [get_bd_pins pl_profiler_0/max_dpu_latency_snapshot] [get_bd_pins pl_sys_ctrl_0/profiler_max_dpu_latency]
connect_bd_net [get_bd_pins pl_profiler_0/max_frame_cycles_snapshot] [get_bd_pins pl_sys_ctrl_0/profiler_max_frame_cycles]
connect_bd_net [get_bd_pins pl_profiler_0/max_result_frame_age_snapshot] [get_bd_pins pl_sys_ctrl_0/profiler_max_result_frame_age]
connect_bd_net [get_bd_pins pl_profiler_0/measurement_error] [get_bd_pins pl_sys_ctrl_0/profiler_measurement_error]
connect_bd_net [get_bd_pins pl_profiler_0/profiled_frames_snapshot] [get_bd_pins pl_sys_ctrl_0/profiler_profiled_frames]
connect_bd_net [get_bd_pins pl_profiler_0/profiled_requests_snapshot] [get_bd_pins pl_sys_ctrl_0/profiler_profiled_requests]
connect_bd_net [get_bd_pins pl_profiler_0/profiled_results_snapshot] [get_bd_pins pl_sys_ctrl_0/profiler_profiled_results]
connect_bd_net [get_bd_pins pl_profiler_0/snapshot_valid] [get_bd_pins pl_sys_ctrl_0/profiler_snapshot_valid]
connect_bd_net [get_bd_pins pl_reset_ctrl_0/adapter_recovery_reset] [get_bd_pins pl_frame_write_adapter_0/recovery_reset]
connect_bd_net [get_bd_pins pl_reset_ctrl_0/datamover_aresetn] \
  [get_bd_pins axi_datamover_0/m_axi_s2mm_aresetn] [get_bd_pins axi_datamover_0/m_axis_s2mm_cmdsts_aresetn] \
  [get_bd_pins axi_dma_0/axi_resetn]
connect_bd_net [get_bd_pins pl_reset_ctrl_0/letterbox_aresetn] [get_bd_pins pl_preproc_letterbox_0/aresetn] [get_bd_pins preproc_error_edge_0/aresetn]
connect_bd_net [get_bd_pins pl_reset_ctrl_0/pipeline_soft_reset] \
  [get_bd_pins pl_error_recovery_0/soft_reset] [get_bd_pins pl_frame_write_adapter_0/soft_reset] \
  [get_bd_pins pc_formatter_0/soft_reset] [get_bd_pins pl_profiler_0/soft_reset] [get_bd_pins pl_video_in_0/soft_reset] \
  [get_bd_pins pl_sad_tracker_0/soft_reset] [get_bd_pins pl_track_fusion_0/soft_reset] \
  [get_bd_pins pl_frame_scheduler_0/soft_reset]
connect_bd_net [get_bd_pins pl_reset_ctrl_0/writer_quiesce] [get_bd_pins not_writer_quiesce/Op1]
connect_bd_net [get_bd_pins pl_sad_tracker_0/init_ready] [get_bd_pins pl_track_fusion_0/tracker_init_ready]
connect_bd_net [get_bd_pins pl_sad_tracker_0/processing_busy] [get_bd_pins pl_sys_ctrl_0/tracker_processing_busy]
connect_bd_net [get_bd_pins pl_sad_tracker_0/track_active] [get_bd_pins pl_sys_ctrl_0/tracker_active]
connect_bd_net [get_bd_pins pl_sad_tracker_0/track_confidence] [get_bd_pins pl_track_fusion_0/tracker_confidence]
connect_bd_net [get_bd_pins pl_sad_tracker_0/track_frame_id] [get_bd_pins pl_track_fusion_0/tracker_frame_id]
connect_bd_net [get_bd_pins pl_sad_tracker_0/track_h] [get_bd_pins pl_track_fusion_0/tracker_h]
connect_bd_net [get_bd_pins pl_sad_tracker_0/track_lost_pulse] [get_bd_pins pl_track_fusion_0/tracker_lost_pulse]
connect_bd_net [get_bd_pins pl_sad_tracker_0/track_result_valid] [get_bd_pins pl_track_fusion_0/tracker_result_valid]
connect_bd_net [get_bd_pins pl_sad_tracker_0/track_sad] [get_bd_pins pl_sys_ctrl_0/track_last_sad]
connect_bd_net [get_bd_pins pl_sad_tracker_0/track_w] [get_bd_pins pl_track_fusion_0/tracker_w]
connect_bd_net [get_bd_pins pl_sad_tracker_0/track_x] [get_bd_pins pl_track_fusion_0/tracker_x]
connect_bd_net [get_bd_pins pl_sad_tracker_0/track_y] [get_bd_pins pl_track_fusion_0/tracker_y]
connect_bd_net [get_bd_pins pl_sys_ctrl_0/clear_error] [get_bd_pins pc_formatter_0/clear_error] [get_bd_pins pl_video_in_0/clear_error]
connect_bd_net [get_bd_pins pl_sys_ctrl_0/enable] \
  [get_bd_pins pl_frame_write_adapter_0/enable] [get_bd_pins pc_formatter_0/enable] [get_bd_pins pl_video_in_0/enable] \
  [get_bd_pins pl_sad_tracker_0/enable] [get_bd_pins pl_track_fusion_0/enable] [get_bd_pins pl_frame_scheduler_0/enable]
connect_bd_net [get_bd_pins pl_sys_ctrl_0/irq] [get_bd_pins dpu_irq_concat/In0]
connect_bd_net [get_bd_pins pl_sys_ctrl_0/profiler_clear_stats] [get_bd_pins pl_profiler_0/clear_stats]
connect_bd_net [get_bd_pins pl_sys_ctrl_0/profiler_snapshot_stats] [get_bd_pins pl_profiler_0/snapshot_stats]
connect_bd_net [get_bd_pins pl_sys_ctrl_0/recovery_clear_status] [get_bd_pins pl_error_recovery_0/clear_status]
connect_bd_net [get_bd_pins pl_sys_ctrl_0/recovery_software_trigger] [get_bd_pins pl_error_recovery_0/software_trigger]
connect_bd_net [get_bd_pins pl_sys_ctrl_0/result_bbox_h] [get_bd_pins pl_track_fusion_0/result_bbox_h]
connect_bd_net [get_bd_pins pl_sys_ctrl_0/result_bbox_w] [get_bd_pins pl_track_fusion_0/result_bbox_w]
connect_bd_net [get_bd_pins pl_sys_ctrl_0/result_bbox_x] [get_bd_pins pl_track_fusion_0/result_bbox_x]
connect_bd_net [get_bd_pins pl_sys_ctrl_0/result_bbox_y] [get_bd_pins pl_track_fusion_0/result_bbox_y]
connect_bd_net [get_bd_pins pl_sys_ctrl_0/result_buffer_id] \
  [get_bd_pins pl_profiler_0/result_buffer_id] [get_bd_pins pl_frame_scheduler_0/result_buffer_id]
connect_bd_net [get_bd_pins pl_sys_ctrl_0/result_commit_pulse] \
  [get_bd_pins pl_track_fusion_0/result_commit_pulse] [get_bd_pins pl_frame_scheduler_0/result_commit_pulse]
connect_bd_net [get_bd_pins pl_sys_ctrl_0/result_confidence] [get_bd_pins pl_track_fusion_0/result_confidence]
connect_bd_net [get_bd_pins pl_sys_ctrl_0/result_frame_id] \
  [get_bd_pins pl_profiler_0/result_frame_id] [get_bd_pins pl_track_fusion_0/result_frame_id] \
  [get_bd_pins pl_frame_scheduler_0/result_frame_id]
connect_bd_net [get_bd_pins pl_sys_ctrl_0/result_generation] \
  [get_bd_pins pl_profiler_0/result_generation] [get_bd_pins pl_frame_scheduler_0/result_generation]
connect_bd_net [get_bd_pins pl_sys_ctrl_0/result_status] [get_bd_pins pl_track_fusion_0/result_status]
connect_bd_net -net pl_sys_ctrl_0_soft_reset_req [get_bd_pins pl_sys_ctrl_0/soft_reset] [get_bd_pins pl_reset_ctrl_0/soft_reset_req]
# net pl_sys_ctrl_0_video_source_select has one end: pl_sys_ctrl_0/video_source_select
connect_bd_net [get_bd_pins pl_track_fusion_0/box_color_flat] [get_bd_pins c_hdmi_display_0/box_color_flat]
connect_bd_net [get_bd_pins pl_track_fusion_0/box_count] [get_bd_pins c_hdmi_display_0/box_count]
connect_bd_net [get_bd_pins pl_track_fusion_0/box_frame_id] [get_bd_pins c_hdmi_display_0/box_frame_id]
connect_bd_net [get_bd_pins pl_track_fusion_0/box_h_flat] [get_bd_pins c_hdmi_display_0/box_h_flat]
connect_bd_net [get_bd_pins pl_track_fusion_0/box_update_valid] [get_bd_pins c_hdmi_display_0/box_update_valid]
connect_bd_net [get_bd_pins pl_track_fusion_0/box_w_flat] [get_bd_pins c_hdmi_display_0/box_w_flat]
connect_bd_net [get_bd_pins pl_track_fusion_0/box_x_flat] [get_bd_pins c_hdmi_display_0/box_x_flat]
connect_bd_net [get_bd_pins pl_track_fusion_0/box_y_flat] [get_bd_pins c_hdmi_display_0/box_y_flat]
connect_bd_net [get_bd_pins pl_track_fusion_0/dpu_request_enable] [get_bd_pins pl_frame_scheduler_0/dpu_ready]
connect_bd_net [get_bd_pins pl_track_fusion_0/dpu_request_reason] [get_bd_pins pl_frame_scheduler_0/dpu_request_reason]
connect_bd_net [get_bd_pins pl_track_fusion_0/fusion_state] [get_bd_pins pl_sys_ctrl_0/fusion_state]
connect_bd_net [get_bd_pins pl_track_fusion_0/result_ack] [get_bd_pins pl_sys_ctrl_0/result_ack]
connect_bd_net [get_bd_pins pl_track_fusion_0/tracker_init_h] [get_bd_pins pl_sad_tracker_0/init_h]
connect_bd_net [get_bd_pins pl_track_fusion_0/tracker_init_valid] [get_bd_pins pl_sad_tracker_0/init_valid]
connect_bd_net [get_bd_pins pl_track_fusion_0/tracker_init_w] [get_bd_pins pl_sad_tracker_0/init_w]
connect_bd_net [get_bd_pins pl_track_fusion_0/tracker_init_x] [get_bd_pins pl_sad_tracker_0/init_x]
connect_bd_net [get_bd_pins pl_track_fusion_0/tracker_init_y] [get_bd_pins pl_sad_tracker_0/init_y]
connect_bd_net [get_bd_pins pl_video_in_0/busy] [get_bd_pins pl_sys_ctrl_0/busy]
connect_bd_net [get_bd_pins pl_video_in_0/err] [get_bd_pins pl_sys_ctrl_0/err] [get_bd_pins protocol_error_or/Op1]
connect_bd_net [get_bd_pins pl_video_in_0/err_code] [get_bd_pins pl_sys_ctrl_0/err_code_in]
connect_bd_net [get_bd_pins pl_video_in_0/frame_cnt] \
  [get_bd_pins pl_sys_ctrl_0/frame_cnt] [get_bd_pins pl_sad_tracker_0/s_frame_id] \
  [get_bd_pins pl_track_fusion_0/current_frame_id] [get_bd_pins c_hdmi_display_0/s_frame_id]
connect_bd_net [get_bd_pins pl_video_in_0/frame_done_pulse] [get_bd_pins pl_sys_ctrl_0/frame_done_pulse]
connect_bd_net [get_bd_pins pl_video_in_0/lock] [get_bd_pins pl_sys_ctrl_0/lock]
connect_bd_net [get_bd_pins preproc_error_edge_0/error_pulse] [get_bd_pins protocol_error_or/Op2]
connect_bd_net [get_bd_pins proc_sys_reset_0/interconnect_aresetn] \
  [get_bd_pins control_smartconnect/aresetn] [get_bd_pins ddr_smartconnect/aresetn] \
  [get_bd_pins dpu_control_placeholder/s_axi_aresetn] [get_bd_pins dpu_control_interconnect/ARESETN] \
  [get_bd_pins dpu_control_interconnect/S00_ARESETN] [get_bd_pins dpu_control_interconnect/M00_ARESETN]
connect_bd_net [get_bd_pins proc_sys_reset_0/peripheral_aresetn] \
  [get_bd_pins pl_error_recovery_0/aresetn] [get_bd_pins pl_frame_write_adapter_0/aresetn] \
  [get_bd_pins pc_formatter_0/aresetn] [get_bd_pins pl_profiler_0/aresetn] [get_bd_pins pl_reset_ctrl_0/aresetn] \
  [get_bd_pins pl_sys_ctrl_0/s00_axi_aresetn] [get_bd_pins pl_video_in_0/video_aresetn] \
  [get_bd_pins pl_axis_video_fork_0/aresetn] [get_bd_pins pl_sad_tracker_0/aresetn] [get_bd_pins pl_track_fusion_0/aresetn] \
  [get_bd_pins c_hdmi_display_0/aresetn] [get_bd_pins hdmi_axis_pack_0/aresetn] \
  [get_bd_pins v014_hdmi_axis_fifo/s_axis_aresetn] [get_bd_pins v014_hdmi_tx_ss/s_axi_cpu_aresetn] \
  [get_bd_pins v014_hdmi_tx_ss/s_axis_video_aresetn] [get_bd_pins v014_hdmi_tx_ss/s_axis_audio_aresetn] \
  [get_bd_pins v014_vid_phy/vid_phy_axi4lite_aresetn] [get_bd_pins v014_vid_phy/vid_phy_sb_aresetn] \
  [get_bd_pins v014_fmch_iic/s_axi_aresetn] [get_bd_pins pl_frame_scheduler_0/aresetn]
connect_bd_net [get_bd_pins protocol_error_or/Res] [get_bd_pins pl_error_recovery_0/video_error_pulse]
connect_bd_net [get_bd_pins reset_aux_inactive_high/dout] \
  [get_bd_pins proc_sys_reset_0/aux_reset_in] [get_bd_pins dpu_rst_300/aux_reset_in] [get_bd_pins dpu_rst_600/aux_reset_in]
connect_bd_net [get_bd_pins v014_acr_zero/dout] [get_bd_pins v014_hdmi_tx_ss/acr_cts] [get_bd_pins v014_hdmi_tx_ss/acr_n]
connect_bd_net [get_bd_pins v014_audio_id_zero/dout] [get_bd_pins v014_hdmi_tx_ss/AUDIO_IN_tid]
connect_bd_net [get_bd_pins v014_audio_zero/dout] [get_bd_pins v014_hdmi_tx_ss/AUDIO_IN_tdata]
connect_bd_net [get_bd_pins v014_fmch_iic/iic2intc_irpt] [get_bd_pins dpu_irq_concat/In4]
connect_bd_net [get_bd_pins v014_hdmi_tx_ss/irq] [get_bd_pins dpu_irq_concat/In2]
connect_bd_net [get_bd_pins v014_hdmi_tx_ss/locked] [get_bd_ports HDMI_LOCKED_LED]
connect_bd_net [get_bd_pins v014_vid_phy/irq] [get_bd_pins dpu_irq_concat/In3]
connect_bd_net [get_bd_pins v014_vid_phy/phy_txn_out] [get_bd_ports HDMI_TX_DAT_N_OUT]
connect_bd_net [get_bd_pins v014_vid_phy/phy_txp_out] [get_bd_ports HDMI_TX_DAT_P_OUT]
connect_bd_net [get_bd_pins v014_vid_phy/tx_tmds_clk_n] [get_bd_ports HDMI_TX_CLK_N_OUT]
connect_bd_net [get_bd_pins v014_vid_phy/tx_tmds_clk_p] [get_bd_ports HDMI_TX_CLK_P_OUT]
connect_bd_net [get_bd_pins v014_vid_phy/tx_video_clk] [get_bd_pins v014_hdmi_tx_ss/video_clk]
connect_bd_net [get_bd_pins v014_vid_phy/txoutclk] [get_bd_pins v014_hdmi_tx_ss/link_clk] [get_bd_pins v014_vid_phy/vid_phy_tx_axi4s_aclk]
connect_bd_net [get_bd_pins writer_ready_gate/Res] [get_bd_pins pl_frame_write_adapter_0/scheduler_frame_start_ready]
connect_bd_net [get_bd_pins zynq_ultra_ps_e_0/pl_clk0] \
  [get_bd_pins axi_datamover_0/m_axi_s2mm_aclk] [get_bd_pins axi_datamover_0/m_axis_s2mm_cmdsts_awclk] \
  [get_bd_pins axi_dma_0/m_axi_mm2s_aclk] [get_bd_pins axi_dma_0/s_axi_lite_aclk] [get_bd_pins control_smartconnect/aclk] \
  [get_bd_pins ddr_smartconnect/aclk] [get_bd_pins pl_error_recovery_0/aclk] [get_bd_pins pl_frame_write_adapter_0/aclk] \
  [get_bd_pins pc_formatter_0/aclk] [get_bd_pins pl_preproc_letterbox_0/aclk] [get_bd_pins pl_profiler_0/aclk] \
  [get_bd_pins pl_reset_ctrl_0/aclk] [get_bd_pins pl_sys_ctrl_0/s00_axi_aclk] [get_bd_pins pl_video_in_0/video_aclk] \
  [get_bd_pins preproc_error_edge_0/aclk] [get_bd_pins proc_sys_reset_0/slowest_sync_clk] \
  [get_bd_pins zynq_ultra_ps_e_0/maxihpm0_lpd_aclk] [get_bd_pins zynq_ultra_ps_e_0/saxihp0_fpd_aclk] \
  [get_bd_pins pl_axis_video_fork_0/aclk] [get_bd_pins pl_sad_tracker_0/aclk] [get_bd_pins pl_track_fusion_0/aclk] \
  [get_bd_pins c_hdmi_display_0/aclk] [get_bd_pins hdmi_axis_pack_0/aclk] [get_bd_pins dpu_clk_wiz/clk_in1] \
  [get_bd_pins v014_hdmi_axis_fifo/s_axis_aclk] [get_bd_pins v014_hdmi_tx_ss/s_axi_cpu_aclk] \
  [get_bd_pins v014_hdmi_tx_ss/s_axis_video_aclk] [get_bd_pins v014_hdmi_tx_ss/s_axis_audio_aclk] \
  [get_bd_pins v014_vid_phy/drpclk] [get_bd_pins v014_vid_phy/vid_phy_axi4lite_aclk] \
  [get_bd_pins v014_vid_phy/vid_phy_sb_aclk] [get_bd_pins v014_fmch_iic/s_axi_aclk] \
  [get_bd_pins dpu_control_placeholder/s_axi_aclk] [get_bd_pins pl_frame_scheduler_0/aclk] \
  [get_bd_pins dpu_control_interconnect/ACLK] [get_bd_pins dpu_control_interconnect/S00_ACLK] \
  [get_bd_pins dpu_control_interconnect/M00_ACLK]
connect_bd_net [get_bd_pins zynq_ultra_ps_e_0/pl_resetn0] \
  [get_bd_pins proc_sys_reset_0/ext_reset_in] [get_bd_pins dpu_clk_wiz/resetn] [get_bd_pins dpu_rst_300/ext_reset_in] \
  [get_bd_pins dpu_rst_600/ext_reset_in]
set_property HDL_ATTRIBUTE.saxihp1_fpd_aclk.FREQ_HZ 299997003 [get_bd_cells zynq_ultra_ps_e_0]
set_property HDL_ATTRIBUTE.saxihp1_fpd_aclk.FREQ_HZ_TOLERANCE 0 [get_bd_cells zynq_ultra_ps_e_0]
set_property HDL_ATTRIBUTE.saxihp1_fpd_aclk.refClockId 0 [get_bd_cells zynq_ultra_ps_e_0]
set_property HDL_ATTRIBUTE.saxihp2_fpd_aclk.FREQ_HZ 299997003 [get_bd_cells zynq_ultra_ps_e_0]
set_property HDL_ATTRIBUTE.saxihp2_fpd_aclk.FREQ_HZ_TOLERANCE 0 [get_bd_cells zynq_ultra_ps_e_0]
set_property HDL_ATTRIBUTE.saxihp2_fpd_aclk.refClockId 0 [get_bd_cells zynq_ultra_ps_e_0]
set_property HDL_ATTRIBUTE.saxihpc0_fpd_aclk.FREQ_HZ 299997003 [get_bd_cells zynq_ultra_ps_e_0]
set_property HDL_ATTRIBUTE.saxihpc0_fpd_aclk.FREQ_HZ_TOLERANCE 0 [get_bd_cells zynq_ultra_ps_e_0]
set_property HDL_ATTRIBUTE.saxihpc0_fpd_aclk.refClockId 0 [get_bd_cells zynq_ultra_ps_e_0]
set_property PFM.CLOCK { clk_out1 {id "0" is_default "true"  proc_sys_reset "dpu_rst_300" status "fixed"} clk_out2 {id "1" is_default "false" proc_sys_reset "dpu_rst_600" status "fixed"} } [get_bd_cells dpu_clk_wiz]
set_property HDL_ATTRIBUTE.aclk.FREQ_HZ 299997003 [get_bd_cells DPUCZDX8G_1]
set_property HDL_ATTRIBUTE.aclk.FREQ_HZ_TOLERANCE 14999850 [get_bd_cells DPUCZDX8G_1]
set_property HDL_ATTRIBUTE.ap_clk_2.FREQ_HZ 599994006 [get_bd_cells DPUCZDX8G_1]
set_property HDL_ATTRIBUTE.ap_clk_2.FREQ_HZ_TOLERANCE 29999700 [get_bd_cells DPUCZDX8G_1]

# ---- address map ----
assign_bd_address -offset 0x0000000000 -range 2G -target_address_space [get_bd_addr_spaces axi_datamover_0/Data_S2MM] [get_bd_addr_segs zynq_ultra_ps_e_0/SAXIGP2/HP0_DDR_LOW]
exclude_bd_addr_seg -offset 0x00FF000000 -range 16M -target_address_space [get_bd_addr_spaces axi_datamover_0/Data_S2MM] [get_bd_addr_segs zynq_ultra_ps_e_0/SAXIGP2/HP0_LPS_OCM]
assign_bd_address -offset 0x00000000 -range 2G -target_address_space [get_bd_addr_spaces axi_dma_0/Data_MM2S] [get_bd_addr_segs zynq_ultra_ps_e_0/SAXIGP2/HP0_DDR_LOW]
exclude_bd_addr_seg -offset 0xFF000000 -range 16M -target_address_space [get_bd_addr_spaces axi_dma_0/Data_MM2S] [get_bd_addr_segs zynq_ultra_ps_e_0/SAXIGP2/HP0_LPS_OCM]
assign_bd_address -offset 0x0000000000 -range 2G -target_address_space [get_bd_addr_spaces DPUCZDX8G_1/M_AXI_GP0] [get_bd_addr_segs zynq_ultra_ps_e_0/SAXIGP0/HPC0_DDR_LOW]
assign_bd_address -offset 0x00FF000000 -range 16M -target_address_space [get_bd_addr_spaces DPUCZDX8G_1/M_AXI_GP0] [get_bd_addr_segs zynq_ultra_ps_e_0/SAXIGP0/HPC0_LPS_OCM]
assign_bd_address -offset 0x0000000000 -range 2G -target_address_space [get_bd_addr_spaces DPUCZDX8G_1/M_AXI_HP0] [get_bd_addr_segs zynq_ultra_ps_e_0/SAXIGP3/HP1_DDR_LOW]
assign_bd_address -offset 0x00FF000000 -range 16M -target_address_space [get_bd_addr_spaces DPUCZDX8G_1/M_AXI_HP0] [get_bd_addr_segs zynq_ultra_ps_e_0/SAXIGP3/HP1_LPS_OCM]
assign_bd_address -offset 0x0000000000 -range 2G -target_address_space [get_bd_addr_spaces DPUCZDX8G_1/M_AXI_HP2] [get_bd_addr_segs zynq_ultra_ps_e_0/SAXIGP4/HP2_DDR_LOW]
assign_bd_address -offset 0x00FF000000 -range 16M -target_address_space [get_bd_addr_spaces DPUCZDX8G_1/M_AXI_HP2] [get_bd_addr_segs zynq_ultra_ps_e_0/SAXIGP4/HP2_LPS_OCM]
assign_bd_address -offset 0x0080000000 -range 64K -target_address_space [get_bd_addr_spaces zynq_ultra_ps_e_0/Data] [get_bd_addr_segs pl_sys_ctrl_0/s00_axi/reg0]
assign_bd_address -offset 0x0080010000 -range 64K -target_address_space [get_bd_addr_spaces zynq_ultra_ps_e_0/Data] [get_bd_addr_segs axi_dma_0/S_AXI_LITE/Reg]
assign_bd_address -offset 0x0080020000 -range 4K -target_address_space [get_bd_addr_spaces zynq_ultra_ps_e_0/Data] [get_bd_addr_segs DPUCZDX8G_1/S_AXI_CONTROL/reg0]
assign_bd_address -offset 0x0082000000 -range 128K -target_address_space [get_bd_addr_spaces zynq_ultra_ps_e_0/Data] [get_bd_addr_segs v014_hdmi_tx_ss/S_AXI_CPU_IN/Reg]
assign_bd_address -offset 0x0082020000 -range 64K -target_address_space [get_bd_addr_spaces zynq_ultra_ps_e_0/Data] [get_bd_addr_segs v014_vid_phy/vid_phy_axi4lite/Reg]
assign_bd_address -offset 0x0082030000 -range 64K -target_address_space [get_bd_addr_spaces zynq_ultra_ps_e_0/Data] [get_bd_addr_segs v014_fmch_iic/S_AXI/Reg]
assign_bd_address -offset 0x0082040000 -range 512 -target_address_space [get_bd_addr_spaces zynq_ultra_ps_e_0/Data] [get_bd_addr_segs dpu_control_placeholder/S_AXI/reg0]

validate_bd_design
save_bd_design
